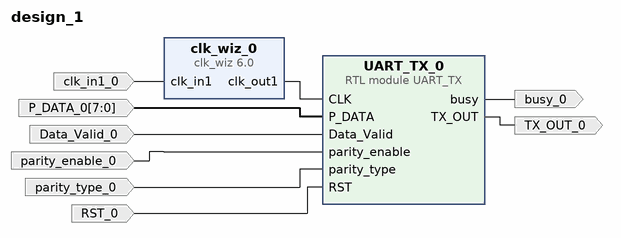
[diagram p0: block diagram of the top level]
# Vivado block design design_1, xc7z010clg400-1, Vivado 2018.2
create_bd_design design_1

create_bd_port -dir I -type clk clk_in1_0
create_bd_port -dir I -type rst RST_0
create_bd_port -dir I -from 7 -to 0 P_DATA_0
create_bd_port -dir I Data_Valid_0
create_bd_port -dir I parity_enable_0
create_bd_port -dir I parity_type_0
create_bd_port -dir O TX_OUT_0
create_bd_port -dir O busy_0

create_bd_cell -type module -reference UART_TX UART_TX_0
create_bd_cell -type ip -vlnv xilinx.com:ip:clk_wiz:6.0 clk_wiz_0
set_property -dict {CONFIG.USE_LOCKED false CONFIG.USE_RESET false} [get_bd_cells clk_wiz_0]

# ---- connections ----

connect_bd_net [get_bd_pins clk_wiz_0/clk_out1] [get_bd_pins UART_TX_0/CLK]
connect_bd_net -net clk_in1_0_1 [get_bd_ports clk_in1_0] [get_bd_pins clk_wiz_0/clk_in1]
connect_bd_net -net P_DATA_0_1 [get_bd_ports P_DATA_0] [get_bd_pins UART_TX_0/P_DATA]
connect_bd_net -net Data_Valid_0_1 [get_bd_ports Data_Valid_0] [get_bd_pins UART_TX_0/Data_Valid]
connect_bd_net -net parity_enable_0_1 [get_bd_ports parity_enable_0] [get_bd_pins UART_TX_0/parity_enable]
connect_bd_net -net parity_type_0_1 [get_bd_ports parity_type_0] [get_bd_pins UART_TX_0/parity_type]
connect_bd_net [get_bd_pins UART_TX_0/TX_OUT] [get_bd_ports TX_OUT_0]
connect_bd_net [get_bd_pins UART_TX_0/busy] [get_bd_ports busy_0]
connect_bd_net -net RST_0_1 [get_bd_ports RST_0] [get_bd_pins UART_TX_0/RST]

validate_bd_design
save_bd_design
